# EasyEDA Pro project 电刺激_两块板_2026-10-19.epro, board PCB2
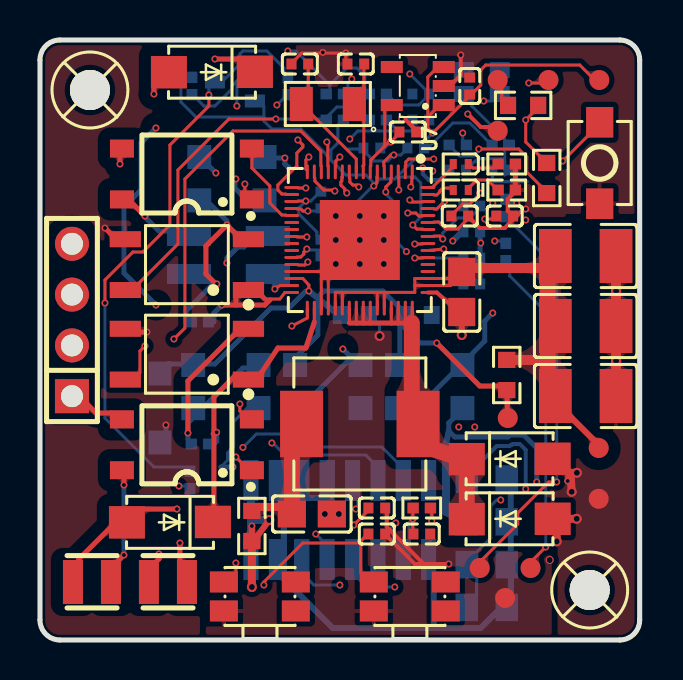
[diagram p5: board, top side]
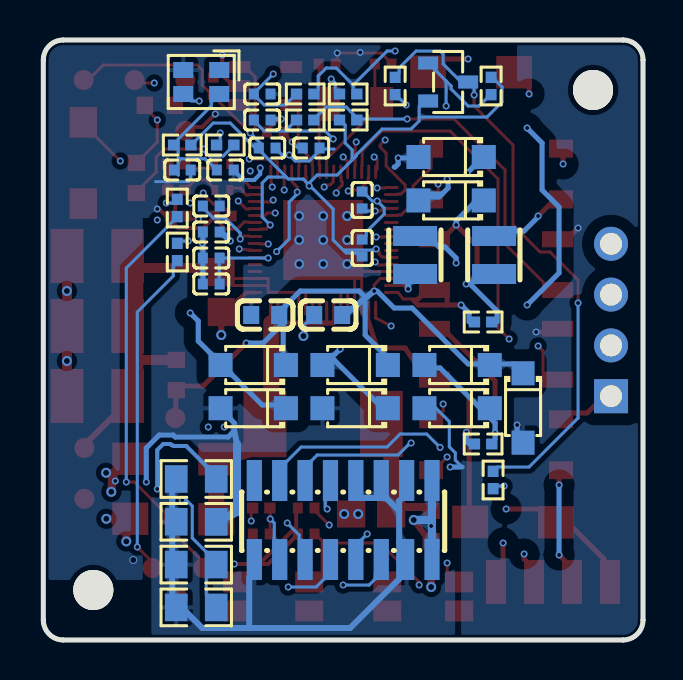
[diagram p6: board, bottom side, seen from below]

Outline 30 x 30 mm; copper layers: Top Layer, GND, SIG1, SIG2, GND2, Bottom Layer. Coordinates in mm from the lower left corner of the outline.
Outline path: 0,29 0,1 arc(0.29,0.29) 1,0 29,0 arc(29.71,0.29) 30,1 30,29 arc(29.71,29.71) 29,30 1,30 arc(0.29,29.71) 0,29
Stack: Top Layer 0.035mm / Dielectric1 1.51mm FR4 er 4.5 / GND 0.035mm / SIG1 0.035mm / SIG2 0.035mm / GND2 0.035mm / Bottom Layer 0.035mm

## Design rules (mm)
net VOUT: PWR
net VBOOST: PWR
net HVDD: HV
net BOOST_OUT: HV_PWR
net STIMU2': HV
net STIMU3: HV
net STIMU0': HV
net STIMU1: HV
net STIMU0: HV
net STIMU2: HV
net SW: HV_PWR
net STIMU0OUT: HV
net STIMU1OUT: HV
net STIMU2OUT: HV
net STIMU3OUT: HV
net STIMU2_SW: HV
net STIMU0_SW: HV
spacing copperThickness1oz (default): track to track 0.102, other pairs 0.152 to 0.3
spacing copperThickness2oz: track to track 0.203, other pairs 0.152 to 0.3
spacing HV_0.6mm: track to track 0.6, other pairs 0.152 to 0.6
track width copperThickness1oz (default): min 0.1, default 0.2, max 2.54
track width copperThickness2oz: min 0.203, default 0.254, max 2.54
track width HV_0.3: min 0.2, default 0.3, max 2.54
track width PWR_0.5: min 0.3, default 0.5, max 5
track width RF_50R: min 0.33, default 0.35, max 0.37
differential pair differentialPair (default): width min 0.127, default 0.254, max 2.54; gap min 0.152, default 0.152
net HVDD uses HV_0.3, HV_0.6mm
net STIMU0 uses HV_0.3, HV_0.6mm
net STIMU1 uses HV_0.3, HV_0.6mm
net STIMU2 uses HV_0.3, HV_0.6mm
net STIMU3 uses HV_0.3, HV_0.6mm
net STIMU0' uses HV_0.3, HV_0.6mm
net STIMU2' uses HV_0.3, HV_0.6mm
net STIMU0_SW uses HV_0.3, HV_0.6mm
net STIMU2_SW uses HV_0.3, HV_0.6mm
net STIMU0OUT uses HV_0.3, HV_0.6mm
net STIMU1OUT uses HV_0.3, HV_0.6mm
net STIMU2OUT uses HV_0.3, HV_0.6mm
net STIMU3OUT uses HV_0.3, HV_0.6mm
net class HV uses HV_0.3, HV_0.6mm
net BOOST_OUT uses HV_0.6mm, PWR_0.5
net SW uses HV_0.6mm, PWR_0.5
net class HV_PWR uses HV_0.6mm, PWR_0.5
net VOUT uses PWR_0.5
net VBOOST uses PWR_0.5
net class PWR uses PWR_0.5
region e457 uses copperThickness1oz

## Placement (name value [footprint] x y rotation side)
C27  100nF  [C0402]  16.85 6.6 0 top
C37  100nF  [C0402]  16.85 5.3 0 top
C40  10uF  [C0402]  20.9 23.5 0 bottom
C41  100nF  [C0402]  23.05 23.5 0 bottom
C42  100nF  [C0402]  18.8 24.6 0 bottom
C43  100nF  [C0402]  16.6 24.6 0 bottom
C44  100nF  [C0402]  14.05 19.6 90 bottom
C45  100nF  [C0402]  23.25 21.2 0 top
C46  18pF  [C0402]  13 28.8 0 top
C47  1uF  [C0402]  21.6 19.1 180 bottom
C48  18pF  [C0402]  15.8 28.8 0 top
C49  100nF  [C0402]  21.6 17.8 0 bottom
C50  100nF  [C0402]  21.6 20.4 0 bottom
C51  1uF  [C0402]  21.6 21.7 0 bottom
C52  100nF  [C0402]  14.05 22 90 bottom
C53  100nF  [C0402]  21 21.2 180 top
C54  10uF  [C0805]  13.6 6.3 180 top
C55  100nF  [C0603]  15.75 16.25 0 bottom
C56  100nF  [C0603]  18.9 16.25 0 bottom
C57  4.7uF  [C1210]  27.3 19.2 180 top
C58  100nF  [C0805]  21.1 17.4 90 top
C59  1uF  [C0402]  19.1 5.3 0 top
C60  10nF  [C0402]  19.05 26 0 bottom
C61  10nF  [C0402]  19.05 27.3 0 bottom
C67  1uF  [C0402]  21.5 27.7 90 top
C68  1uF  [C0402]  18.4 25.4 0 top
C70  4.7uF  [C1210]  27.3 15.7 180 top
C71  4.7uF  [C1210]  27.3 12.2 180 top
D2  SS26  [SMA_L4.3-W2.6-LS5.0-FD]  6.5 5.89 0 top
D3  SS26  [SMA_L4.3-W2.6-LS5.0-FD]  8.6 28.4 0 top
D4  SS26  [SMA_L4.3-W2.6-LS5.0-FD]  23.5 9.05 180 top
D12  SS26  [SMA_L4.3-W2.6-LS5.0-FD]  23.5 6.05 180 top
D18  SMF60A_R1_00001  [SOD-123FL_L2.7-W1.8-LS3.8-RD]  9.6 24.15 0 bottom
D19  SMF60A_R1_00001  [SOD-123FL_L2.7-W1.8-LS3.8-RD]  9.6 21.98 0 bottom
D20  SMF85A  [SOD-123FL_L2.7-W1.8-LS3.7-RD]  6 11.6 270 bottom
D21  SMF60A_R1_00001  [SOD-123FL_L2.7-W1.8-LS3.8-RD]  19.5 13.75 0 bottom
D22  SMF60A_R1_00001  [SOD-123FL_L2.7-W1.8-LS3.8-RD]  19.5 11.59 0 bottom
D23  SMF60A_R1_00001  [SOD-123FL_L2.7-W1.8-LS3.8-RD]  9.3 13.75 0 bottom
D24  SMF60A_R1_00001  [SOD-123FL_L2.7-W1.8-LS3.8-RD]  9.3 11.59 0 bottom
D25  SMF60A_R1_00001  [SOD-123FL_L2.7-W1.8-LS3.8-RD]  14.4 13.75 0 bottom
D26  SMF60A_R1_00001  [SOD-123FL_L2.7-W1.8-LS3.8-RD]  14.4 11.59 0 bottom
H9  PZ254V-11-04P  [HDR-TH_4P-P2.54-V-M]  1.6 16 90 top
J2  KH-1.27FH-2X8P-H4.3-SMT  [CONN-SMD_16P-P1.27_KINGHELM_KH-1.27FH-2X8P-H4.3-SMT]  15 6 0 bottom
L1  100uH  [IND-SMD_L7.1-W6.6]  16 10.8 0 top
L9  22uH  [IND-SMD_L2.5-W2.0_SWPA252012S]  7.45 19.25 90 bottom
L10  22uH  [IND-SMD_L2.5-W2.0_SWPA252012S]  11.4 19.25 90 bottom
L11  22uH  [IND-SMD_L2.5-W2.0_SWPA252012S]  2.6 2.9 0 top
L12  22uH  [IND-SMD_L2.5-W2.0_SWPA252012S]  6.4 2.9 0 top
LED4  NCD0402G1  [LED-SMD_L1.0-W0.5_FC-F1005UGK]  21.05 22.5 180 top
LED5  NCD0402G1  [LED-SMD_L1.0-W0.5_FC-F1005UGK]  21.05 23.8 180 top
Q4  NX2301P,215  [SOT-23-3_L2.9-W1.3-P1.90-LS2.4-BR]  9.75 27.9 0 bottom
R18  0Ω  [R0603]  10.6 5.7 90 top
R19  1kΩ  [R0402]  23.3 21.6 90 bottom
R20  1kΩ  [R0402]  23.3 19.4 90 bottom
R21  0Ω  [R0805]  22.35 8.05 0 bottom
R22  0Ω  [R0805]  22.35 5.91 0 bottom
R23  0Ω  [R0805]  22.35 3.77 0 bottom
R24  0Ω  [R0805]  22.35 1.63 0 bottom
R25  10kΩ  [R0402]  19.1 6.6 0 top
R26  10kΩ  [R0402]  8 15.9 0 bottom
R27  1kΩ  [R0402]  23.35 23.8 0 top
R28  10kΩ  [R0402]  14.75 26 0 bottom
R29  1kΩ  [R0402]  16.9 26 0 bottom
R30  10kΩ  [R0402]  8 9.8 0 bottom
R31  10kΩ  [R0402]  14.75 27.3 0 bottom
R32  1kΩ  [R0402]  16.9 27.3 0 bottom
R33  220Ω  [R0402]  7.5 8 90 bottom
R34  220Ω  [R0402]  12.4 27.7 90 bottom
R36  1kΩ  [R0402]  23.35 22.5 0 top
R41  22Ω  [R0402]  20.9 24.75 0 bottom
R42  120Ω  [R0402]  23.05 24.75 0 bottom
R50  100kΩ  [R0402]  7.6 27.7 90 bottom
R55  0Ω  [R0603]  23.35 13.25 90 top
R56  0Ω  [R0603]  24.17 26.73 0 top
R57  0Ω  [R0603]  25.35 23.1 90 top
RST1  轻触开关3x4x2  [Key_SMD_3x4x2]  28 23.85 90 top
SCREW1  -  [M2螺丝]  2.5 27.5 0 top
SCREW2  -  [M2螺丝]  27.5 2.5 0 top
SW2  EVQP7A01P  [SW-SMD_EVQP7A01P]  11 2.18 0 top
SW4  EVQP7A01P  [SW-SMD_EVQP7A01P]  18.5 2.18 0 top
TP8  -  [Test-Point-0.5mm]  22.9 28 0 top
TP9  -  [Test-Point-0.5mm]  25.44 28 0 top
TP10  -  [Test-Point-0.5mm]  27.98 28 0 top
TP11  -  [Test-Point-0.5mm]  22.9 25.46 0 top
TP12  -  [Test-Point-0.5mm]  23.27 2.1 0 top
TP13  -  [Test-Point-0.5mm]  22 3.6 0 top
TP14  -  [Test-Point-0.5mm]  24.54 3.6 0 top
TP15  -  [Test-Point-0.5mm]  27.95 9.6 0 top
TP16  -  [Test-Point-0.5mm]  23.4 11.1 0 top
TP19  -  [Test-Point-0.5mm]  27.95 7.06 0 top
U2  KAQY214STLD  [SOP-4_L3.9-W4.4-P2.54-LS7.0-BR]  7.35 23.3 0 top
U7  NNC6121  [QFN-64_L7.0-W7.0-P0.35-TL-EP4.0]  16 20 270 top
U13  LTV-357T  [SOP-4_L3.9-W4.4-P2.54-LS7.0-TL]  7.35 18.77 180 top
U15  LTV-357T  [SOP-4_L3.9-W4.4-P2.54-LS7.0-TL]  7.35 14.29 180 top
U21  KAQY214STLD  [SOP-4_L3.9-W4.4-P2.54-LS7.0-BR]  7.35 9.76 0 top
U23  AP2127K-1.8TRG1  [SOT-23-5_L3.0-W1.7-P0.95-LS2.8-BR]  18.9 27.7 0 top
X3  32MHz  [OSC-SMD_4P-L2.0-W1.6-BL]  22.1 27.9 0 bottom
X4  32.768kHz  [OSC-SMD_2P-L3.2-W1.5]  14.4 26.8 180 top

## Footprints (pads in the part's own frame, mm; a bottom-side part is the same pattern mirrored in y, then rotated)
C0402
  rect 0.5x0.54 smd: 1(-0.42,0) 2(0.42,0)
C0603
  rect 0.8x0.9 smd: 1(-0.7,0) 2(0.7,0)
C0805
  rect 1.41x1.35 smd: 1(-1,0) 2(1,0)
C1210
  rect 1.635x2.7 smd: 1(-1.518,0) 2(1.518,0)
CONN-SMD_16P-P1.27_KINGHELM_KH-1.27FH-2X8P-H4.3-SMT
  rect 0.76x2.05 smd: 1(-4.445,-1.975) 2(-4.445,1.975) 3(-3.175,-1.975) 4(-3.175,1.975) 5(-1.905,-1.975) 6(-1.905,1.975) 7(-0.635,-1.975) 8(-0.635,1.975) 9(0.635,-1.975) 10(0.635,1.975) 11(1.905,-1.975) 12(1.905,1.975) 13(3.175,-1.975) 14(3.175,1.975) 15(4.445,-1.975) 16(4.445,1.975)
HDR-TH_4P-P2.54-V-M
  rect 1.7x1.7 hole 1.1: 1(-3.81,0)
  round 1.7 hole 1.1: 2(-1.27,0) 3(1.27,0) 4(3.81,0)
IND-SMD_L2.5-W2.0_SWPA252012S
  rect 1x2.2 smd: 1(-0.951,0) 2(0.951,0)
IND-SMD_L7.1-W6.6
  rect 2.15x3.32 smd: 1(-2.913,0) 2(2.913,0)
Key_SMD_3x4x2
  rect 1.53x1.36 smd: 1(-2.035,0) 2(2.035,0)
LED-SMD_L1.0-W0.5_FC-F1005UGK
  rect 0.35x0.5 smd: 1(-0.375,0) 2(0.375,0)
M2螺丝
  round 2 hole 2: 1(0,0)
OSC-SMD_2P-L3.2-W1.5
  rect 1.15x1.7 smd: 1(-1.325,0) 2(1.325,0)
OSC-SMD_4P-L2.0-W1.6-BL
  rect 1x0.8 smd: 1(-0.9,-0.6) 2(0.9,-0.6) 3(0.9,0.6) 4(-0.9,0.6)
QFN-64_L7.0-W7.0-P0.35-TL-EP4.0
  oval 0.74x0.15 smd: 1(-3.408,2.625) 2(-3.408,2.275) 3(-3.408,1.925) 4(-3.408,1.575) 5(-3.408,1.225) 6(-3.408,0.875) 7(-3.408,0.525) 8(-3.408,0.175) 9(-3.408,-0.175) 10(-3.408,-0.525) 11(-3.408,-0.875) 12(-3.408,-1.225) 13(-3.408,-1.575) 14(-3.408,-1.925) 15(-3.408,-2.275) 16(-3.408,-2.625) 33(3.408,-2.625) 34(3.408,-2.275) 35(3.408,-1.925) 36(3.408,-1.575) 37(3.408,-1.225) 38(3.408,-0.875) 39(3.408,-0.525) 40(3.408,-0.175) 41(3.408,0.175) 42(3.408,0.525) 43(3.408,0.875) 44(3.408,1.225) 45(3.408,1.575) 46(3.408,1.925) 47(3.408,2.275) 48(3.408,2.625)
  oval 0.15x0.74 smd: 17(-2.625,-3.408) 18(-2.275,-3.408) 19(-1.925,-3.408) 20(-1.575,-3.408) 21(-1.225,-3.408) 22(-0.875,-3.408) 23(-0.525,-3.408) 24(-0.175,-3.408) 25(0.175,-3.408) 26(0.525,-3.408) 27(0.875,-3.408) 28(1.225,-3.408) 29(1.575,-3.408) 30(1.925,-3.408) 31(2.275,-3.408) 32(2.625,-3.408) 49(2.625,3.408) 50(2.275,3.408) 51(1.925,3.408) 52(1.575,3.408) 53(1.225,3.408) 54(0.875,3.408) 55(0.525,3.408) 56(0.175,3.408) 57(-0.175,3.408) 58(-0.525,3.408) 59(-0.875,3.408) 60(-1.225,3.408) 61(-1.575,3.408) 62(-1.925,3.408) 63(-2.275,3.408) 64(-2.625,3.408)
  rect 4x4 smd: 65(0,0)
R0402
  rect 0.566x0.54 smd: 1(-0.433,0) 2(0.433,0)
R0603
  rect 0.806x0.864 smd: 1(-0.753,0) 2(0.753,0)
R0805
  rect 1.133x1.377 smd: 1(-1,0) 2(1,0)
SMA_L4.3-W2.6-LS5.0-FD
  rect 1.8x1.62 smd: 1(-2.15,-0.009) 2(2.15,0.009)
SOD-123FL_L2.7-W1.8-LS3.7-RD
  rect 1.2x1.15 smd: 1(-1.735,0) 2(1.735,0)
SOD-123FL_L2.7-W1.8-LS3.8-RD
  rect 1.2x1.2 smd: 1(-1.635,0) 2(1.635,0)
SOP-4_L3.9-W4.4-P2.54-LS7.0-BR
  rect 1.199x0.9 smd: 1(3.25,-1.27) 2(3.25,1.27) 3(-3.25,1.27) 4(-3.25,-1.27)
SOP-4_L3.9-W4.4-P2.54-LS7.0-TL
  rect 1.56x0.8 smd: 1(-3.08,1.27) 2(-3.08,-1.27) 3(3.08,-1.27) 4(3.08,1.27)
SOT-23-3_L2.9-W1.3-P1.90-LS2.4-BR
  rect 1x0.65 smd: 1(1,-0.95) 2(1,0.95) 3(-1,0)
SOT-23-5_L3.0-W1.7-P0.95-LS2.8-BR
  rect 1.1x0.6 smd: 1(1.3,-0.95) 2(1.3,0) 3(1.3,0.95) 4(-1.3,0.95) 5(-1.3,-0.95)
SW-SMD_EVQP7A01P
  rect 1.4x1.05 smd: 1(-1.8,0.725) 1'(1.8,0.725) 2(-1.8,-0.725) 2'(1.8,-0.725)
Test-Point-0.5mm
  round 1 smd: 1(0,0)

## Nets
As in the schematic.

Pads without a net: J2 15; SCREW1 1; SCREW2 1; SW2 1' 2'; SW4 1' 2'; U7 22 23 52 53; U23 4; X3 1

## Via types
v1: diameter 0.35, hole 0.2, Top Layer to Bottom Layer, 119 vias
v2: diameter 0.4, hole 0.3, Top Layer to Bottom Layer, 1 via
v3: diameter 0.5, hole 0.3, Top Layer to Bottom Layer, 21 vias

## Routing (per net, layer and track width the routed paths; a pad name or vN(x,y) marks a point on that pad's centre or on a via; arc(x,y) is an arc through that point)
1V8: length 22.3
  Top Layer w0.15: 20.75,21.4 21.15,21.8 21.5,21.8 22,22.3 v1(22,22.35) ; 17.25,26.5 17.25,24.7 ; 17.25,24.7 17.45,24.9 v1(17.55,24.9) 17.85,25.2 ; 17.25,24.7 16.55,24 16.55,23.7 ; v1(13.4,21.45) 13.15,21.45 13.05,21.55 12.85,21.55 ; v1(18.4,21.35) 18.8,21.35 18.95,21.2 19.15,21.2
  SIG2 w0.15: 14.3,22.1 14.55,21.85 17.25,21.85 17.7,21.4 18.4,21.4 ; 14.3,22.1 14.3,22.65 15.3,23.65 16.3,23.65 v1(17.55,24.9) ; 14.3,22.1 13.65,21.45 v1(13.4,21.45) ; 18.4,21.4 20.4,21.4 21.35,22.35 v1(22,22.35) ; 18.4,21.4 v1(18.4,21.35)
  Bottom Layer w0.15: v1(17.55,24.9) 17.2,24.55 ; 13.85,21.45 v1(13.4,21.45)
AGND: length 29.6
  Top Layer w0.15: v1(18.75,19.8) 19.15,19.8
  SIG1 w0.15: v1(23.05,7) 24.45,8.4 24.45,20.85 v1(24.3,21)
  SIG2 w0.15: v1(18.75,19.8) 19.45,19.1 21.3,19.1 23.2,21 v1(24.3,21)
  Bottom Layer w0.15: v1(23.05,7) 22.85,7 22.55,6.7 22.55,5.1 21.85,4.4 21.85,2.25
  Bottom Layer w0.25: C49.2 C47.1 C50.2
  vias: v1(22.05,19.85)
DGND: length 61.6
  Top Layer w0.15: v1(13.3,21.95) 12.9,21.95 ; 15.3,29 v1(15.3,29.35) 13.1,29.35 12.75,29 ; 12.9,18.75 13.25,18.75 v1(13.4,18.9) ; 21.35,21 20.9,20.55 20.35,20.55 20.3,20.6 20.25,20.6 19.95,20.9 19.7,20.9 ; 15.5,23.1 15.5,22.9 15.65,22.75 15.85,22.75 v1(15.95,22.65) ; 17.2,23.7 17.2,23.9 17.55,24.25 v1(17.7,24.25)
  Top Layer w0.2: 22.55,25.65 22.05,25.65 v1(21.4,26.3) ; 20.65,27.85 21.05,28.25 v1(21.05,29.25) ; 23.7,22.35 23.4,22.05 23.4,21.45 23.5,21.35 ; v1(18.1,26.05) 18.25,26.05 18.75,25.55 ; v1(24.3,21.55) 24.2,21.55 23.25,20.6 22,20.6 21.55,21.05 ; 19.2,3.8 18.75,3.8 17.4,5.15 ; 19.2,3.8 17.35,5.65 17.35,6.45 ; 19.2,3.8 v1(20.45,3.8)
  Top Layer w0.25: R27.2 R36.2
  SIG1 w0.15: v1(13.4,18.9) 13.1,18.9 12.8,19.2 12.8,21.45 13.2,21.85
  SIG1 w0.2: v1(19.15,23.6) 19.15,25 v1(18.1,26.05)
  SIG2 w0.15: v1(15.3,29.35) 16.85,27.8 16.85,25.3 15.9,24.35 15.45,24.55 ; 15.35,24.65 14.9,24.65 13.75,23.5 13.75,22.4 v1(13.3,21.95)
  SIG2 w0.2: v1(24.3,7.55) 20.55,3.8 v1(20.45,3.8)
  Bottom Layer w0.15: 16,24.55 15.45,24.55 ; 18.2,24.4 18.05,24.25 v1(17.7,24.25) 17.4,23.95 16.7,23.95 16.25,24.4 ; 24.38,22.92 22.73,22.92 22.63,23.02 C41.1 ; 13.2,21.85 12.95,21.6 12.95,21.3 13.85,20.4 13.85,20.2 ; v1(13.3,21.95) 13.55,21.95 13.85,22.25
  Bottom Layer w0.2: v1(19.15,23.6) 19.15,23.3 19.45,23 20,23 20.35,23.35 ; 18.5,26.05 v1(18.1,26.05) ; v1(24.3,7.55) 24.3,9.5 24,9.8 23.65,9.8 23.6,9.75 23.55,9.75 23.5,9.7 22.85,9.7 21.8,8.65
  vias: v1(14.15,29.38) v2(25.5,4)
GND: length 27.4
  Bottom Layer w0.3: 12.2,6.45 12.2,4.9 ; 12.2,6.45 12.85,7.1 14.15,7.1 ; 12.2,6.45 12.2,6.95 12.05,7.1 ; 12.2,4.9 12.2,3.05 14.65,0.6 19.7,0.6 ; 12.2,4.9 12.05,4.9 ; 19.7,0.6 22.05,0.6 23.55,2.1 23.55,7.5 ; 19.7,0.6 19.7,3.15
VDD: length 84.1
  Top Layer w0.15: 19.75,26.5 19.4,26.15 ; 19.4,26.15 19.4,28.15 19.7,28.45 ; 19.4,26.15 19.4,25.6 v1(19.65,25.35) 22.05,27.75 22.05,28.5 22.3,28.75 27,28.75 27.6,28.15 ; 19.15,20.55 18.85,20.55 v1(18.65,20.75) ; 19.6,6.4 v1(19.6,5.95) ; 12.85,19.15 13.05,19.15 13.2,19.3 13.2,19.4 v1(13.35,19.55) ; 16.85,23.15 16.85,22.85 v1(16.7,22.7) ; 22.65,21.05 v1(22.25,21.05)
  SIG1 w0.15: v1(19.6,5.95) 23.7,10.05 23.7,19.6 v1(22.25,21.05) ; v1(19.65,25.35) 16.95,28.05 v1(15.6,28.05)
  SIG2 w0.15: v1(19.6,5.95) 16.4,2.75 v1(15,2.75) ; v1(18.65,20.75) 21.95,20.75 v1(22.25,21.05)
  Bottom Layer w0.15: 16.75,22.8 16.3,23.25 15.3,23.25 14.35,24.2 14.35,24.25 13.05,25.55 11.6,25.55 11.2,25.95 11.2,26.15 ; 16.75,22.8 16.7,22.75 ; 16.75,22.8 17,23.05 17.75,23.05 17.85,23.15 ; 14.25,19.35 14.85,19.35 15.5,20 15.5,21.55 16.7,22.75 ; 7.4,28 7.05,27.65 7.05,26.9 7.8,26.15 11.2,26.15 ; v1(15.6,28.05) 15.4,27.85 15.4,27.5 ; 11.2,26.15 11.2,26.7 ; 13.4,3.05 13.7,2.75 v1(15,2.75) ; 19.4,24.6 20.65,25.85 21.5,25.85 22.4,24.95 ; 16.7,22.75 v1(16.7,22.7) ; 17.85,23.15 18.75,23.15 19.05,22.85 19.05,21.15 v1(18.65,20.75) ; 17.85,23.15 19.1,24.4 ; 14.95,25.8 14.9,25.75 14.9,24.85 14.55,24.5 14.55,24 ; 14.9,19.5 13.4,19.5 v1(13.35,19.55) ; v1(19.65,25.35) 19.1,24.8
BOOST_OUT: length 26.5
  Top Layer w0.15: 17.23,17.38 18.75,17.38 18.75,17.72 ; 17.23,17.38 17.23,16.59 ; 17.23,17.38 16.88,17.38 ; 18.75,17.72 18.75,18.08 U7.51 20.55,18.08 ; 18.75,17.72 U7.50 20.55,17.72 ; U7.37 14.78,17.38 15.13,17.38 ; U7.43 16.88,17.38 ; 16.88,17.38 15.13,17.38 ; 15.13,17.38 15.13,16.59
  Top Layer w0.3: 27.8,9.9 26.45,11.25
  Top Layer w0.5: 23.35,14 25.2,14 ; 21.1,18.6 25.4,18.6
  Top Layer w0.8: 25.4,19.2 25.4,12.2
GPIO0: length 9
  Top Layer w0.15: 25,24.2 24.3,24.9 v1(24.3,26) 24.65,26.35 ; 19.7,21.55 19.85,21.55 v1(20.25,21.95)
  SIG1 w0.15: v1(24.3,26) v1(20.25,21.95)
GPIO2: length 1
  Top Layer w0.15: 19.7,22.25 19.85,22.25 20,22.4 20,22.45 20.15,22.6 20.55,22.6
GPIO5: length 1.3
  Top Layer w0.15: 19.65,22.65 20.6,23.6
GPIO12: length 10.9
  Top Layer w0.15: 15.1,23.15 15.1,22.95 15.05,22.9 15.05,22.75 15.25,22.55 15.25,22.45 v1(15.35,22.35)
  SIG1 w0.15: v1(22.75,19.95) 21.7,21 20.6,21 19.8,21.8 19.8,22 18.6,23.2 15.6,23.2 15.25,22.85 15.25,22.45 v1(15.35,22.35)
  Bottom Layer w0.15: v1(22.75,19.95) 23.1,19.95
GPIO13: length 11.8
  Top Layer w0.15: v1(15,24.15) 14.8,23.95 14.8,23.7
  SIG2 w0.15: v1(23.85,21.85) 21.15,24.55 19.85,24.55 19.05,25.35 17.35,25.35 16,24 15.85,24 15.8,24.05 15.1,24.05 v1(15,24.15)
  Bottom Layer w0.15: v1(23.85,21.85) 23.5,21.85
GPIO14: length 7
  Top Layer w0.15: v1(14.35,24.9) 14.4,24.85 14.4,23.7
  SIG1 w0.15: v1(15.5,25.05) 15.35,24.9 v1(14.35,24.9)
  Bottom Layer w0.15: v1(15.5,25.05) 15.9,25.45 17.9,25.45 ; 19.3,25.8 18.95,25.45 17.9,25.45 ; 17.55,25.8 17.9,25.45
GPIO15: length 40.1
  Top Layer w0.15: 14.05,23.7 14.05,24.45 13.05,25.45 9.65,25.45 7.25,23.05 7.25,15.6 v1(6.7,15.05) ; v1(11.2,2.75) 11.2,2.9 13.15,4.85 15.95,4.85 16.05,4.95 ; 16.05,4.95 16.25,5.15 ; 16.05,4.95 16.05,3.35
  SIG1 w0.15: v1(11.2,2.75) 10.8,3.15 9.7,3.15 9.2,3.65 9.2,9.15 9.7,9.65 9.7,10.75 6.7,13.75 v1(6.7,15.05)
GPIO16: length 27.7
  Top Layer w0.15: 13.75,23.1 13.75,22.95 14.2,22.5 14.7,22.5 v1(14.75,22.45) ; 9.8,3.35 v1(9.8,3.85) ; v1(15.7,5.75) 16.35,6.4
  SIG1 w0.15: 13.65,7.45 10.05,3.85 v1(9.8,3.85) ; 13.65,7.45 13.65,14.3 14.75,15.4 14.75,17.95 14.3,18.4 14.3,22.05 14.7,22.45 v1(14.75,22.45) ; 13.65,7.45 13.65,6.05 14.1,5.6 15.55,5.6 v1(15.7,5.75)
GPIO17: length 22
  Top Layer w0.15: v1(13.45,24.15) 13.3,24 13.3,23.55 13.35,23.5
  SIG1 w0.15: v1(11.6,9.85) 11.6,13.45 14.4,16.25 14.4,17.85 13.95,18.3 13.95,23.65 v1(13.45,24.15)
  Bottom Layer w0.15: v1(11.6,9.85) 11.65,9.85 12.25,9.25 16.3,9.25 16.6,8.95
GPIO18: length 13.1
  Top Layer w0.15: v1(10,11.8) 10,11.45 10.05,11.4 ; v1(13.3,22.6) 12.9,22.6
  SIG1 w0.15: v1(13.3,22.6) 13.2,22.5 13.05,22.5 10.4,19.85 10.4,12.2 v1(10,11.8)
GPIO20: length 17.9
  Top Layer w0.15: v1(12.9,25) 13.15,24.75 13.15,24.65 12.85,24.35 12.85,23.7 11.9,22.75 11.9,22.5 12.1,22.3 12.3,22.3
  SIG1 w0.15: v1(18.5,28.3) 18.25,28.55 12.7,28.55 11.3,27.15 11.3,25.9 12.05,25.15 12.75,25.15 v1(12.9,25)
  Bottom Layer w0.15: v1(18.5,28.3) 19.3,27.5 ; 17.55,27.1 17.9,26.75 18.95,26.75 19.3,27.1
GPIO21: length 3.8
  Top Layer w0.15: 12.3,21.25 12.1,21.25 11.5,21.85 11.5,22.7 10.6,23.6 10.6,24.2
HGND: length 38.6
  Top Layer w0.15: 14.07,16.59 14.07,18.1 ; U7.36 14.43,18.1 ; 12.6,18.43 14.1,18.43
  Top Layer w0.2: 20.55,16.75 19.85,17.37 19.41,17.37
  Top Layer w0.25: 3.6,20.25 v1(3.25,20.6) ; 4.95,15.4 v1(5.35,15.4) ; 26.4,8.35 v1(26.4,7.95)
  Top Layer w0.3: 21.1,16 v3(21.1,15.25)
  Top Layer w0.4: 26.55,8.36 v3(26.86,8.36) ; 26.55,8.25 v3(26.6,7.41) ; 25.85,5.25 v3(25.85,4.93) ; 26.55,6.06 v3(26.85,6.06)
  Top Layer w0.5: 28.82,19.2 v3(28.82,17.45) v3(28.82,13.95) 28.82,12.2
  Bottom Layer w0.15: 16.51,16.19 16.99,15.71 v3(16.99,15.2) ; D24.2 10.36,11.59 9.69,10.92 9.69,9.66 9.39,9.36 9.39,9 9.04,8.65
  Bottom Layer w0.25: 20.85,11.25 20.45,10.85 20.45,10.45 20.75,10.15 23.4,10.15 23.5,10.25 24.2,10.25 24.85,9.6 v1(24.85,7.9) ; 10.05,22.3 9.75,22.6 9.75,23 v1(9.8,23.05) ; 10.05,22.3 11.2,22.3 ; 10.05,22.3 10.2,22.15 10.8,22.15 ; C55.2 16.51,16.19 ; 9.04,8.65 v1(9.65,8.65) ; 6.3,10.35 v1(6.3,10.75)
  Bottom Layer w0.3: 20.31,9.8 20.45,10.45
  Bottom Layer w0.4: R22.1 20.31,6.4 20.31,9.8
  vias: v3(14.25,6.3) v3(14.8,21.2) v3(14.8,20) v3(14.8,18.8) v3(14.95,6.3) v3(16,21.2) v3(16,20) v3(16,18.8) v3(17.2,21.2) v3(17.2,20) v3(17.2,18.8)
HVDD: length 37.5
  Top Layer w0.15: 12.6,18.08 13.15,18.08 13.45,17.75 v1(13.45,17.45)
  Top Layer w0.25: v1(19.85,14.85) 22,12.7 23.05,12.7 ; TP16.1 23.35,12.4
  SIG2 w0.25: v1(8.8,23.35) 8.8,22.75 9.95,21.6 10,21.6 12.2,19.4 12.2,18.6 13.1,17.7 13.3,17.7 13.4,17.6
  Bottom Layer w0.25: 13.3,17.45 12.45,16.6 11.55,16.6 8.75,13.8 6.45,13.8 ; 18,15.85 18,16.6 17.15,17.45 14.2,17.45 13.95,17.2 ; 18,15.85 18,14.2 ; 18,15.85 19,14.85 v1(19.85,14.85) ; 13.9,16.9 13.9,15.25 12.85,14.2 ; 8.3,23.85 v1(8.8,23.35)
  Bottom Layer w0.3: v1(13.45,17.45) 14.75,16.4
NNC_32K_IN: length 6.7
  Top Layer w0.15: U7.9 15.82,24.05 X4.2 13.42,27.14 C46.2
NNC_32K_OUT: length 4.9
  Top Layer w0.15: 16.15,23.7 16.2,23.75 16.2,28.6
NNC_32M: length 6
  Top Layer w0.15: v1(21.95,24.55) 23.95,24.55 24.35,24.15 24.35,23.4 25.05,22.7
  Bottom Layer w0.15: v1(21.95,24.55) 21.95,24.45 21.7,24.2 21,24.2 20.65,24.55
NNC_NRST: length 39.7
  Top Layer w0.15: 12.85,20.15 v1(13.35,20.15) ; 27.4,25.2 v1(26.15,23.95) ; 18.65,6.4 18.65,5.5
  SIG2 w0.15: 26.15,16.3 25.2,17.25 19.9,17.25 17.85,19.3 14.2,19.3 v1(13.35,20.15) ; 26.15,16.3 26.15,13.55 v1(18.65,6.05) ; 26.15,16.3 v1(26.15,23.95)
  Bottom Layer w0.15: 18.45,5 18.45,5.85 v1(18.65,6.05)
NNC_RX: length 15.8
  Top Layer w0.15: 24.65,4 v1(25.3,4.65)
  Bottom Layer w0.15: 23.5,18.75 23.5,18.2 25.3,16.4 v1(25.3,4.65)
NNC_SWCLK: length 0.6
  Top Layer w0.15: 23.1,27.1 23.1,27.65
NNC_SWDIO: length 10
  Top Layer w0.15: v1(24.45,27.85) 25.05,27.85 ; v1(18.5,22) 18.6,21.9 19.15,21.9
  SIG1 w0.15: v1(24.45,27.85) 20.05,23.45 v1(19.65,23.45)
  SIG2 w0.15: v1(18.5,22) 18.7,22 19.65,22.95 v1(19.65,23.45)
NNC_TX: length 19.7
  Top Layer w0.15: v1(25.85,7.9) 25.45,7.9 23.9,6.35 23.9,5.8 22.1,4
  Bottom Layer w0.15: v1(25.85,7.9) 25.85,18.6 23.5,20.95
PHOTOMOS_VCC: length 28.6
  Top Layer w0.15: v1(3.25,16.85) 3.25,18 4.65,19.4 5.15,19.4 6.5,20.75 6.5,24.75 8.45,26.7 v1(8.45,27.25)
  Bottom Layer w0.15: 12.2,28.35 12.2,28.6 11.35,29.45 10.15,29.45 10,29.3 10,28.8 9.2,28 ; v1(8.45,27.25) 8.45,27.65 ; 7.3,8.65 5.7,8.65 3.25,11.1 v1(3.25,16.85)
SPI_CLK: length 26.2
  Top Layer w0.15: 18.6,23.15 18.6,22.7 v1(18.55,22.65)
  SIG1 w0.15: v1(18.55,22.65) 19.25,21.95 19.25,18.9 18.8,18.45 18.8,11.95 20.6,10.15 21.1,10.15 21.6,10.65 v1(21.75,10.65)
  SIG2 w0.15: v1(21.75,10.65) 21.65,10.65 16.3,5.3 v1(13.8,5.3)
  Bottom Layer w0.15: 14.1,5 v1(13.8,5.3)
SPI_CS: length 19.1
  Top Layer w0.15: 17.55,23.1 17.55,22.9 17.3,22.65 v1(17.3,22.4)
  SIG1 w0.15: v1(17.8,5.85) 17.8,6.6 18.2,7 18.2,19.25 v1(18.33,19.42)
  Bottom Layer w0.15: v1(18.33,19.42) 17.7,20.05 17.7,21.9 17.3,22.3 v1(17.3,22.4) ; v1(17.8,5.85) 17.2,5.25 17.2,5
SPI_MISO: length 18
  Top Layer w0.15: v1(17.95,22.5) 17.95,23.15
  SIG1 w0.15: v1(17.95,22.5) 17.95,21.85 17.8,21.7 17.8,8.55 v1(15.8,6.55)
  Bottom Layer w0.15: 15.9,7 15.9,6.65 v1(15.8,6.55)
SPI_MOSI: length 30.1
  Top Layer w0.15: 18.3,23.7 18.3,23.9 18.45,24.05 v1(19.7,24.05)
  SIG1 w0.15: v1(22.65,21.85) 24.05,20.45 24.05,8.95 v1(17.75,2.65)
  SIG2 w0.15: v1(19.7,24.05) 20.9,24.05 22.65,22.3 v1(22.65,21.85)
  Bottom Layer w0.15: 15.95,3.05 16.35,2.65 v1(17.75,2.65)
STIM_EN_N: length 32.5
  SIG2 w0.15: v1(10.15,9.63) 10.15,10.85 7.75,13.25 7.75,24.6 v1(9.85,26.7)
  Bottom Layer w0.15: 9.85,27.95 9.6,27.7 9.6,27.55 8.75,26.7 8.2,26.7 7.8,27.1 ; 9.85,27.95 v1(9.85,26.7) ; 9.85,27.95 10.5,28.6 ; 17.85,8.9 17.1,9.65 12.8,9.65 12.15,10.3 10.82,10.3 v1(10.15,9.63)
STIMU0: length 14.1
  Top Layer w0.15: 13.73,16.59 13.73,15.9
  Top Layer w0.25: 8.66,10.31 8.7,10.31 ; 8.7,10.31 8.7,12.15 9.75,13.2 10.9,13.2 ; 8.7,10.31 8.7,6.6 ; 8.7,10.31 8.76,10.31 v1(8.84,10.39) ; 13.73,15.9 13.3,14.6 11.9,14.6 11,13.25
  Bottom Layer w0.25: 8.7,9.8 8.84,9.94 v1(8.84,10.39)
STIMU0': length 21.8
  Top Layer w0.25: v1(7.4,10.35) 7.4,12.95 9.75,15.3 ; v1(6.85,6.55) 4.45,6.55 1.95,4.05 1.95,3.9
  SIG1 w0.25: v1(7.4,10.35) 7.4,8.75 8,8.15 8,7.25 7.3,6.55 v1(6.85,6.55)
  Bottom Layer w0.25: 7.4,10.05 7.4,10.85 10.15,13.6 10.5,13.6
STIMU0_SW: length 4.4
  Top Layer w0.25: 3.85,3.9 v1(4.2,4.25) ; v1(4.2,7.75) 4.2,8.15
  Bottom Layer w0.25: v1(4.2,4.25) v1(4.2,7.75)
STIMU0OUT: length 1.6
  Top Layer w0.25: 2.25,11.9 2.8,11.35 3.6,11.35
STIMU1: length 25.4
  Top Layer w0.15: U7.33 13.38,16.1 v1(12.6,15.7)
  Top Layer w0.25: v1(5.95,4.3) 5.95,4.05 5.8,3.9
  SIG2 w0.25: v1(15.15,14.55) 14.4,13.8 ; 14.4,13.8 15.9,12.3 8.55,4.95 8.55,4.9 7.45,3.8 6.45,3.8 v1(5.95,4.3) ; 14.4,13.8 12.65,15.55
  Bottom Layer w0.25: v1(15.15,14.55) 15.7,14 15.45,14 13.2,11.75
STIMU1OUT: length 12.5
  Top Layer w0.25: 7,3.9 v1(7,4.85)
  SIG2 w0.25: 2.2,14.4 5.25,11.35 5.25,6.6 v1(7,4.85)
STIMU2: length 25.2
  Top Layer w0.15: 11.25,17.05 12,17.05 12.25,17.37 12.6,17.37
  Top Layer w0.25: v1(9.1,16.75) 9.8,16.75 ; 9.8,16.75 11.25,16.75 11.5,17 ; 9.8,16.75 9.8,17.2 ; 11.25,17.05 11,17.3 ; 9.95,29.05 v1(8.75,29.05)
  SIG1 w0.25: v1(5.8,16.75) v1(9.1,16.75)
  SIG2 w0.25: v1(8.75,29.05) 6.7,27 6.7,26.5 v1(5.8,25.6)
  Bottom Layer w0.25: 8.7,15.9 8.7,16.35 v1(9.1,16.75) ; v1(5.8,25.6) 5.05,24.85 5.05,22.5 4.2,21.65 4.2,18.35 v1(5.8,16.75)
STIMU2': length 23.6
  Top Layer w0.25: 5.7,27.7 v1(5.7,27.3) ; 9.8,20.3 v1(9.35,20.75) 8.3,19.7 8.3,18.3 8.8,17.8 v1(8.85,17.8)
  SIG1 w0.25: v1(9.35,20.75) 7.75,22.35 7.75,23.8 8.95,25 ; 8.95,25 6.65,27.3 v1(5.7,27.3) ; 8.95,25 9.85,24.1 v1(12.25,24.1)
  Bottom Layer w0.25: v1(9.35,20.75) 9.35,20.95 8.4,21.9 ; 8.45,18 8.65,17.8 ; 8.65,17.8 7.3,16.45 7.3,15.9 ; 8.65,17.8 v1(8.85,17.8) ; 11.7,24.1 v1(12.25,24.1) 12.25,23.8 12.4,23.65 12.45,23.65
STIMU2_SW: length 2.5
  Top Layer w0.25: v1(5.25,21.2) 4.55,21.9
  Bottom Layer w0.25: v1(5.25,21.2) 5.25,21.15 5.95,20.45 6.45,20.45
STIMU2OUT: length 7.6
  Top Layer w0.25: 4,24.25 v1(4,23.8)
  SIG2 w0.25: 2.2,17.65 4.3,19.75 4.3,20.75 4.25,20.8 4.25,20.9 4.2,20.95 4.2,23.6 v1(4,23.8)
STIMU3: length 19.5
  Top Layer w0.15: v1(11.75,17.55) 12,17.72 12.6,17.72
  SIG2 w0.25: v1(22.65,16.35) 13.25,16.35 12.9,16.7 12.7,16.7 11.9,17.5
  Bottom Layer w0.25: v1(22.65,16.35) 22.25,15.95 22.25,14.95 19.05,11.75 18.3,11.75
  Bottom Layer w0.3: v1(11.75,17.55) 11.75,18.1
STIMU3OUT: length 9
  SIG1 w0.25: 2.25,19.5 2.9,18.85 v1(9.35,18.85)
  Bottom Layer w0.25: 10.4,19.85 10.2,19.65 9.9,19.65 9.35,19.1 v1(9.35,18.85)
SW: length 17.4
  Top Layer w0.15: 17.57,16.59 17.57,15.85 ; 18.63,16.59 18.63,15.85 ; U7.39 15.48,15.85 ; U7.46 17.93,15.85 ; U7.47 18.28,15.85 ; U7.40 15.82,15.85 ; U7.42 16.53,15.85 ; U7.41 16.18,15.85
  Top Layer w0.25: 18.63,15.85 15.48,15.85
  Top Layer w0.8: 19.5,9.6 21,9.1 ; 18.6,15.85 18.6,12.1 ; D4.2 D12.2
VBOOST: length 4.8
  Top Layer w0.4: 12.4,6.65 10.6,6.65
  Top Layer w0.8: 12.6,9.5 12.6,6.5
VOUT: length 29.9
  Top Layer w0.15: U7.55 v1(20.2,19.55)
  Top Layer w0.3: v1(10.6,5.7) 10.6,5.2 ; v3(11.47,6) 10.8,5.1
  Top Layer w0.4: 10.6,4.54 v3(10.6,2.65)
  SIG1 w0.3: v1(20.2,19.55) 20.65,19.55 ; 20.65,19.55 v1(20.65,19.95) ; 20.65,19.55 20.65,16.5 21.7,15.45 21.7,12.2 20.95,11.45 v1(20.95,10.65)
  SIG2 w0.3: 11.5,6.25 15.9,10.65 v1(20.95,10.65)
  Bottom Layer w0.3: 21.1,20.4 v1(20.65,19.95)
  Bottom Layer w0.4: v3(11.47,6) 10.56,6 ; 10.56,6 10.56,4.8 ; 10.56,6 10.56,7.1
$1N67: length 3
  Top Layer w0.15: v1(20.15,20.05) 20,20.2 19.7,20.2
  Bottom Layer w0.15: v1(20.15,20.05) 20.15,20.35 20.9,21.1 21.5,21.1 21.9,21.5
$1N70: length 3.6
  Top Layer w0.15: 19.15,19.1 v1(18.75,19.1)
  Bottom Layer w0.15: v1(18.75,19.1) 21,19.1 ; 21.2,18 21.2,18.9
$1N156: length 2.8
  SIG1 w0.15: v1(22.2,26.95) 22.2,26.4 v1(21.15,25.35)
  Bottom Layer w0.15: 22.6,26.95 v1(22.2,26.95) ; v1(21.15,25.35) 21.15,24.95
$1N159: length 6.7
  Bottom Layer w0.15: 23.25,23.92 23.25,25.05 21.6,26.7 21.6,26.95 ; 23.25,23.92 23.25,23.25 23.3,23.3 ; 23.25,23.92 23.11,24.06 21.92,24.06 21.8,23.95 21.77,23.95 C40.2
$1N168: length 1.5
  Top Layer w0.15: 21.5,22.65 21.85,23 22.4,23 22.7,22.7
$1N169: length 1.2
  Top Layer w0.15: 22.7,23.6 21.65,23.6 21.55,23.7
$3N6: length 5.6
  Top Layer w0.15: 10.25,22.4 v1(10.25,22.8)
  SIG2 w0.15: v1(11.85,26.75) 11.7,26.75 10.25,25.3 v1(10.25,22.8)
  Bottom Layer w0.15: v1(11.85,26.75) 12.2,27.1
$3N9: length 4.2
  Top Layer w0.15: 10.1,8.85 v1(9.8,9.15)
  SIG2 w0.15: v1(6.95,7.7) 8.4,9.15 v1(9.8,9.15)
  Bottom Layer w0.15: v1(6.95,7.7) 7.3,7.7
$3N15: length 25.5
  Top Layer w0.15: 5,13.35 5,14.45 v1(5.25,14.7)
  SIG2 w0.15: v1(5.25,14.7) 7.35,16.8 7.35,25 11.8,29.45 v1(12.4,29.45)
  Bottom Layer w0.15: 16.25,27.5 16.25,28.2 15.85,28.6 15.35,28.6 14.5,27.75 ; 14.5,27.75 12.8,29.45 v1(12.4,29.45) ; 14.5,27.75 14.5,27.5
$3N16: length 17
  Top Layer w0.15: v1(11.8,26.05) 9.45,26.05 6.9,23.5 6.9,19.8 4.95,17.85
  Bottom Layer w0.15: v1(11.8,26.05) 14.1,26.05 ; 14.4,26.2 14.85,26.65 15.85,26.65 16.3,26.2

## Copper pours and planes (outline as drawn; the poured copper is in the pictures)
AGND on Bottom Layer: 20.3,20.8 22.5,20.8 22.5,16.1 20.3,16.1
DGND on Top Layer: 8.3,3.6 16.4,3.6 16.4,7.2 22.6,7.2 22.6,4.4 25.6,4.4 25.6,0.01 8.3,0.01
DGND on Top Layer: 11.6,29.99 29.99,29.99 29.99,21.3 26.3,21.3 26.3,19.4 20.9,19.4 20.9,25 11.6,25
DGND on Bottom Layer: 6.73,29.99 30.12,29.99 30.12,3 25.03,3 25.03,21.1 19.93,21.1 19.93,23.8 12.13,23.8 12.13,25.4 6.73,25.4
DGND on GND: 8.3,3.6 16.4,3.6 16.4,7.2 22.6,7.2 22.6,4.4 25.6,4.4 25.6,0.01 8.3,0.01
DGND on GND: 11.6,29.99 29.99,29.99 29.99,21.3 26.3,21.3 26.3,19.4 20.9,19.4 20.9,18.1 18.3,18.1 18.3,21.7 13.9,21.7 13.9,18.6 12,18.6 12,25 11.6,25
DGND on GND2: 11.6,29.99 29.99,29.99 29.99,21.3 26.3,21.3 26.3,19.4 20.9,19.4 20.9,18.1 18.3,18.1 18.3,21.7 13.9,21.7 13.9,18.6 12,18.6 12,25 11.6,25
DGND on GND2: 8.3,3.6 16.4,3.6 16.4,7.2 22.6,7.2 22.6,4.4 25.6,4.4 25.6,0.01 8.3,0.01
GND on Bottom Layer: 9.4,9.1 24.6,9.1 24.6,0.01 9.4,0.01
HGND on Top Layer: 0.01,29.99 11.3,29.99 11.3,24.7 20.6,24.7 20.6,19.1 26,19.1 26,21 29.99,21 29.99,0.01 25.9,0.01 25.9,4.7 22.9,4.7 22.9,7.5 16.1,7.5 16.1,3.9 8,3.9 8,0.01 0.01,0.01
HGND on Bottom Layer: 0.01,29.99 6.3,29.99 6.3,25.1 11.7,25.1 11.7,23.5 19.5,23.5 19.5,20.8 20,20.8 20,15.8 22.8,15.8 22.8,20.8 24.6,20.8 24.6,9.4 9.1,9.4 9.1,0.01 0.01,0.01
HGND on GND: 0.01,29.99 11.3,29.99 11.3,24.7 11.7,24.7 11.7,18.3 14.2,18.3 14.2,21.4 18,21.4 18,17.8 21.2,17.8 21.2,19.1 26.6,19.1 26.6,21 29.99,21 29.99,0.01 25.9,0.01 25.9,4.7 22.9,4.7 22.9,7.5 16.1,7.5 16.1,3.9 8,3.9 8,0.01 0.01,0.01
HGND on GND2: 0.01,29.99 11.3,29.99 11.3,24.7 11.7,24.7 11.7,18.3 14.2,18.3 14.2,21.4 18,21.4 18,17.8 21.2,17.8 21.2,19.1 26.6,19.1 26.6,21 29.99,21 29.99,0.01 25.9,0.01 25.9,4.7 22.9,4.7 22.9,7.5 16.1,7.5 16.1,3.9 8,3.9 8,0.01 0.01,0.01

Small or netless copper shapes (teardrops, artwork), in the pictures only: 277 on Top Layer, 203 on Bottom Layer, 53 on SIG1, 52 on SIG2
